# Altium schematic sheet Main.SchDoc: ControlBoard(Pump&Motor) V1.0
size A; DrawnBy: Jiang Lianhui; SheetNumber: 1; SheetTotal: 1
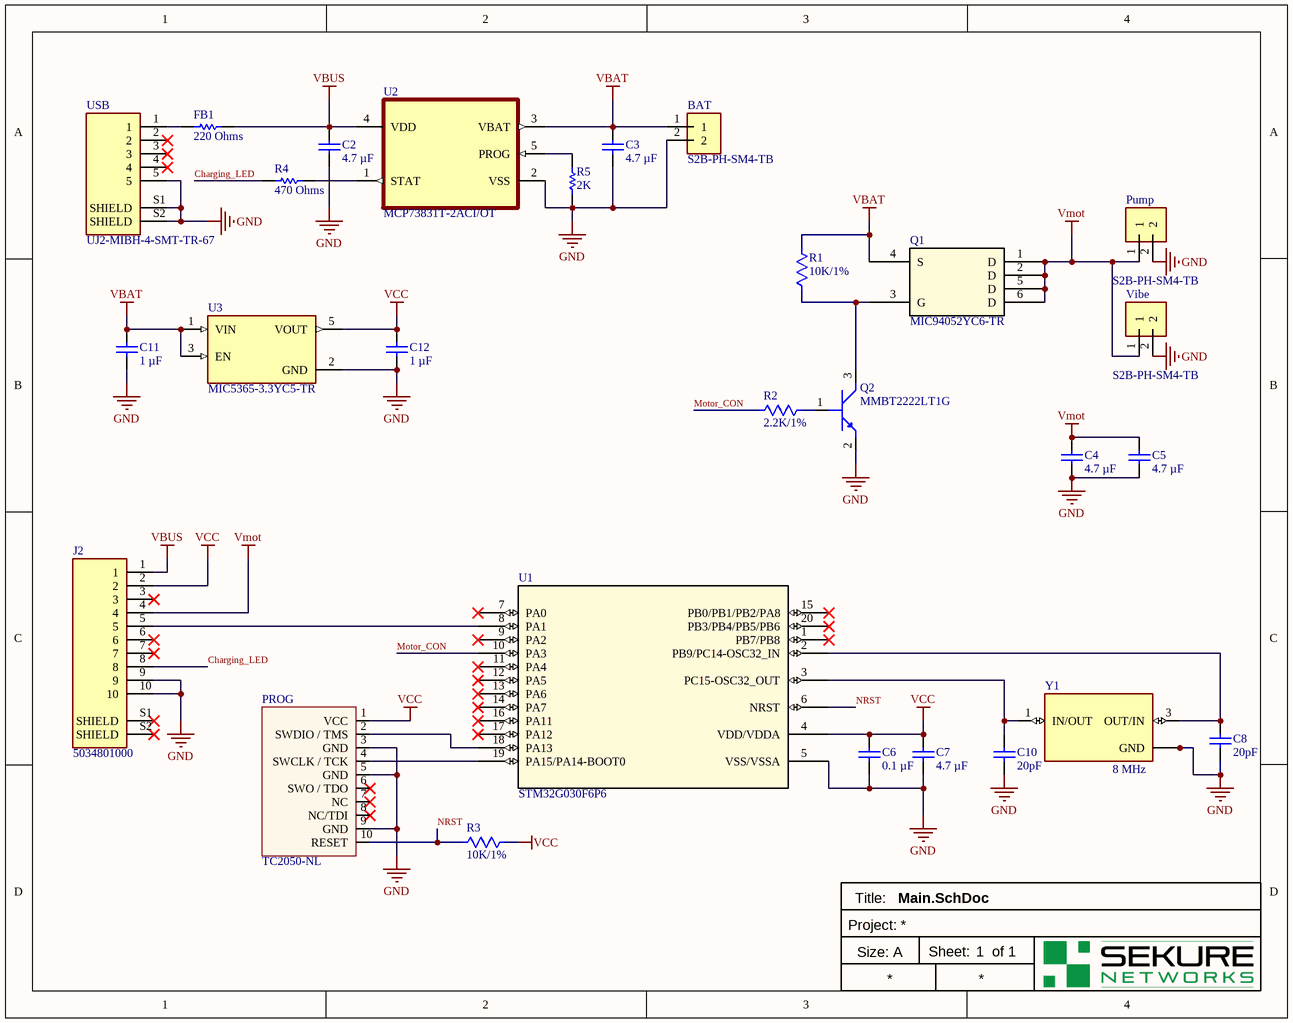
[diagram p0: Main.SchDoc]

## Parts
BAT  S2B-PH-SM4-TB  [JST_S2B-PH-SM4-TB]
C2  4.7 µF  [CAP0603]
C3  4.7 µF  [CAP0603]
C4  4.7 µF  [CAP0603]
C5  4.7 µF  [CAP0603]
C6  0.1 µF  [CAP0603]
C7  4.7 µF  [CAP0603]
C8  20pF  [CAP0603]
C10  20pF  [CAP0603]
C11  1 µF  [CAP0603]
C12  1 µF  [CAP0603]
FB1  220 Ohms  [RES_0603]
J2  5034801000  [MOLEX_5034801000]
PROG  value TC2050-NL  [TC2050]  (hidden comment: Programming Connector)
Pump  S2B-PH-SM4-TB  [JST_S2B-PH-SM4-TB]
Q1  MIC94052YC6-TR  [SC70-6_MC_MCH]
Q2  value MMBT2222LT1G  [SOT23]  (hidden comment: Transistor)
R1  value 10K/1%  [RES 0603]  (hidden comment: Resistor)
R2  value 2.2K/1%  [RES 0603]  (hidden comment: Resistor)
R3  value 10K/1%  [RES 0603]  (hidden comment: Resistor)
R4  470 Ohms  [RES_0603]
R5  2K  [RES_0603]
U1  STM32G030F6P6  [TSSOP20]
U2  MCP73831T-2ACI/OT  [SOT95P280X145-5N]
U3  MIC5365-3.3YC5-TR  [SOT65P210X110-5N]
USB  UJ2-MIBH-4-SMT-TR-67  [CUI_UJ2-MIBH-4-SMT-TR-67]
Vibe  S2B-PH-SM4-TB  [JST_S2B-PH-SM4-TB]
Y1  value 8 MHz  [XTAL_ECS-240-8-33-AGN-TR]  (hidden comment: ECS-80-12-33-JGN-TR)

## Nets
GND: BAT.2 C2.1 C3.1 C4.1 C5.1 C6.1 C7.1 C8.1 C10.1 C11.1 C12.1 J2.9 J2.10 PROG.3(GND) PROG.5(GND) PROG.9(GND) Pump.2 Q2.2(e) R5.1 U1.5(VSS/VSSA) U2.2(VSS) U3.2(GND) USB.5 USB.S1(SHIELD) USB.S2(SHIELD) Vibe.2 Y1.2(GND) Y1.4(GND)
VBAT: BAT.1 C3.2 C11.2 Q1.4(S) R1.2 U2.3(VBAT) U3.1(VIN) U3.3(EN)
VBUS: C2.2 FB1.2 J2.1 U2.4(VDD)
VCC: C6.2 C7.2 C12.2 J2.2 PROG.1(VCC) R3.2 U1.4(VDD/VDDA) U3.5(VOUT)
Vmot: C4.2 C5.2 J2.4 Pump.1 Q1.1(D) Q1.2(D) Q1.5(D) Q1.6(D) Vibe.1
Charging_LED: J2.8 R4.1
Motor_CON: R2.1 U1.10(PA3)
NRST: PROG.10(RESET) R3.1 U1.6(NRST)
NetC8_2: C8.2 U1.2(PB9/PC14-OSC32_IN) Y1.3(OUT/IN)
NetC10_2: C10.2 U1.3(PC15-OSC32_OUT) Y1.1(IN/OUT)
NetFB1_1: FB1.1 USB.1
NetJ2_5: J2.5 U1.8(PA1)
NetPROG_2: PROG.2(SWDIO_/_TMS) U1.18(PA13)
NetPROG_4: PROG.4(SWCLK_/_TCK) U1.19(PA15/PA14-BOOT0)
NetQ1_3: Q1.3(G) Q2.3(c) R1.1
NetQ2_1: Q2.1(b) R2.2
NetR4_2: R4.2 U2.1(STAT)
NetR5_2: R5.2 U2.5(PROG)

Not connected (* = marked no-connect by the designer): J2 3* 6* 7* S1(SHIELD)* S2(SHIELD)*; PROG 6(SWO_/_TDO)* 7(NC)* 8(NC/TDI)*; U1 1(PB7/PB8)* 7(PA0)* 9(PA2)* 11(PA4)* 12(PA5)* 13(PA6)* 14(PA7)* 15(PB0/PB1/PB2/PA8)* 16(PA11)* 17(PA12)* 20(PB3/PB4/PB5/PB6)*; USB 2* 3* 4*

## Notes on the sheet
- Title:
- Project:
- Size: A
- Sheet:
- of

## Library data of the parts
BAT Pump Vibe = S2B-PH-SM4-TB: Connector Header Surface Mount, Right Angle 2 position 0.079 (2.00mm); Part: S2B-PH-SM4-TB; Value: S2B-PH-SM4-TB
C2-C5 C7 = Capacitor: CAP CER 4.7UF 10V X5R 0603; Part: CL10A475KP8NNNC; Value: 4.7 µF
C6 = Capacitor: CAP CER 0.1UF 50V X7R 0603; Part: CL10B104KB8NNNC; Value: 0.1 µF
C8 C10 = Capacitor: CAP CER 20PF 50V C0G/NPO 0603; Part: CC0603JRNPO9BN200; Value: 20pF
C11 C12 = Capacitor: CAP CER 1UF 16V X7R 0603; Part: C0603C105K4RAC7867; Value: 1 µF
FB1 = Res: FERRITE BEAD 220 OHM 0603 1LN; Part: BLM18PG221SN1D; Value: 220 Ohms
J2 = 5034801000: 10 Position FFC, FPC Connector Contacts, Top and Bottom 0.020 _0.50mm_ Surface Mount, Right Angle; Value: 10; Part: 5034801000
PROG = TC2050: “No Legs” 10-pin Plug-of-Nails™ Cable fitted with a 10-pin 0.1″ pitch ribbon connector.; Assembly: DNP
Q1 = MIC94052YC6-TR: MOSFET P-CH 6V 2A SC70-6; Part: MIC94052YC6-TR; Value: MOSFET P-CH 6V 2A SC70-6
Q2 = MMBT2222LT1G: Small Signal Bipolar Transistor, 0.6A I(C), 30V V(BR)CEO, 1-Element, NPN, Silicon, TO-236; Manufacturer: ON Semiconductor; Package Body Material: Plastic; Max Collector Current: 600mA; DC Current Gain-Min (hFE): 75; Number of Elements: 1; Power Dissipation-Max (Abs): 225mW; Time @ Peak Reflow Temperature-Max (s): 40s; Transistor Application: SWITCHING; Frequency: 250MHz; Turn-off Time-Max (toff): 285ns; Turn-on Time-Max (ton): 35ns; Qualification Status: Not Qualified; Supplier: Digikey; DigiKey: MMBT2222LT1GOSCT-ND; P/N: MMBT2222LT1G; RoHS: Yes; Category: BJTs; Stock: 84926; Pricing: 1=0.14, 10=0.085, 100=0.0523, 500=0.03782, 1000=0.03311 (USD); Pins: 3; Package Shape: Rectangular; Terminal Finish: Tin; Transistor Element Material: SILICON; Max Operating Temperature: 150°C; JESD-609 Code: e3; Polarity/Channel Type: NPN; Collector-emitter Voltage-Max: 30V; JESD-30 Code: R-PDSO-G3; Moisture Sensitivity Level: 1; Package Style: SMALL OUTLINEMeter; Peak Reflow Temperature (Cel): 260°C; Surface Mount: Yes; Terminal Form: Gull Wing; Terminal Position: DUAL; JEDEC-95 Code: TO-236; Reach SVHC Compliant: Yes; RoHS Compliant: Yes; ComponentLink1URL: https://datasheet.ciiva.com:443/pdfs/VipMasterIC/IC/ONSM/ONSM-S-A0002809824/ONSM-S-A0002809824-1.pdf?src-supplier=IHS+Markit; ComponentLink1Description: https://datasheet.ciiva.com:443/pdfs/VipMasterIC/IC/ONSM/ONSM-S-A0002809824/ONSM-S-A0002809824-1.pdf?src-supplier=IHS+Markit; ComponentLink2URL: https://datasheet.ciiva.com/976/mmbt2222lt1-d-976368.pdf?src-supplier=Digikey; ComponentLink2Description: https://datasheet.ciiva.com/976/mmbt2222lt1-d-976368.pdf?src-supplier=Digikey; ComponentLink3URL: https://datasheet.ciiva.com/976/mmbt2222lt1-d-976369.pdf?src-supplier=Digikey; ComponentLink3Description: https://datasheet.ciiva.com/976/mmbt2222lt1-d-976369.pdf?src-supplier=Digikey; ComponentLink4URL: https://datasheet.ciiva.com/976/mmbt2222lt1-d-976370.pdf?src-supplier=Digikey; ComponentLink4Description: https://datasheet.ciiva.com/976/mmbt2222lt1-d-976370.pdf?src-supplier=Digikey; ComponentLink5URL: https://datasheet.ciiva.com/4721/mmbt2222lt1-d-80103-4721468.pdf?src-supplier=Mouser; ComponentLink5Description: https://datasheet.ciiva.com/4721/mmbt2222lt1-d-80103-4721468.pdf?src-supplier=Mouser; ComponentLink6URL: https://datasheet.ciiva.com/11198/mmbt2222lt1-d-11198974.pdf?src-supplier=Avnet; ComponentLink6Description: https://datasheet.ciiva.com/11198/mmbt2222lt1-d-11198974.pdf?src-supplier=Avnet; ComponentLink7URL: https://datasheet.ciiva.com/11201/mmbt2222lt1-d-11201758.pdf?src-supplier=Avnet; ComponentLink7Description: https://datasheet.ciiva.com/11201/mmbt2222lt1-d-11201758.pdf?src-supplier=Avnet; ComponentLink8URL: https://datasheet.ciiva.com/15224/getdatasheetpartid-91924-15224358.pdf?src-supplier=Verical; ComponentLink8Description: https://datasheet.ciiva.com/15224/getdatasheetpartid-91924-15224358.pdf?src-supplier=Verical
R1 R3 = RC0603FR-0710KL: RES SMD 10K OHM 1% 1/10W 0603; Manufacturer: Yageo; Resistance: 10kR; Power Rating: 100mW; Temperature Coefficient: 100ppm/°C; Voltage Rating: 75V; Voltage Rating (DC): 50V; Supplier 1: Digi-Key; P/N: RC0603FR-0710KL; Stock 1: 55833360; Pricing 1: 1=0.10000, 10=0.02300, 100=0.00940, 1000=0.00421, 2500=0.00366 (USD); RoHS: Yes; Case/Package: 0603; Number of Pins: 2; Weight: 7.1E-05oz; Case Code (Imperial): 0603; Case Code (Metric): 1608; Min Operating Temperature: -55°C; Max Operating Temperature: 155°C; Packaging: Tape and Reel; Tolerance: 1%; Composition: Thick Film; Termination: SMD/SMT; Military Standard: Not; Length: 1.6mm; Height: 0.45mm; Depth: 0.8mm; Width: 0.8mm; Lead Pitch: 0.3mm; Lead Free: Lead Free; REACH SVHC: No SVHC; ComponentLink1URL: https://datasheet.ciiva.com/7660/38590-7660789.pdf?src-supplier=Element14; ComponentLink1Description: https://datasheet.ciiva.com/7660/38590-7660789.pdf?src-supplier=Element14; ComponentLink2URL: https://datasheet.ciiva.com/15189/getdatasheetpartid-409289-15189591.pdf?src-supplier=Verical; ComponentLink2Description: https://datasheet.ciiva.com/15189/getdatasheetpartid-409289-15189591.pdf?src-supplier=Verical; ComponentLink3URL: https://datasheet.ciiva.com/46440/1868787-46440891.pdf?src-supplier=Element14; ComponentLink3Description: https://datasheet.ciiva.com/46440/1868787-46440891.pdf?src-supplier=Element14; ComponentLink4URL: https://datasheet.ciiva.com/7983/443971-7983596.pdf?src-supplier=Element14; ComponentLink4Description: https://datasheet.ciiva.com/7983/443971-7983596.pdf?src-supplier=Element14; ComponentLink5URL: https://datasheet.ciiva.com/7746/1738695-7746239.pdf?src-supplier=Element14; ComponentLink5Description: https://datasheet.ciiva.com/7746/1738695-7746239.pdf?src-supplier=Element14; ComponentLink6URL: https://datasheet.ciiva.com/22747/443971-22747519.pdf?src-supplier=Element14; ComponentLink6Description: https://datasheet.ciiva.com/22747/443971-22747519.pdf?src-supplier=Element14; DigiKey: 311-10.0KHRDKR-ND
R2 = CRCW06032K20FKEA: RES SMD 2.2K OHM 1% 1/10W 0603; Manufacturer: Vishay; Resistance: 2.2kR; Temperature Coefficient: 100ppm/°C; Power Rating: 100mW; Voltage Rating: 75V; Supplier 1: Digi-Key; P/N: CRCW06032K20FKEA; Stock 1: 98601; Pricing 1: 1=0.10000, 10=0.03400, 100=0.01390, 1000=0.00623, 2500=0.00540 (USD); RoHS: Yes; Mount: Surface Mount; Case/Package: 0603; Weight: 7.1E-05oz; Case Code (Metric): 1608; Case Code (Imperial): 0603; Contact Plating: Tin; Min Operating Temperature: -55°C; Max Operating Temperature: 155°C; Tolerance: 1%; Packaging: Tape and Reel; Composition: Thick Film; Termination: SMD/SMT; Package Quantity: 10; Voltage Rating (DC): 75V; Number of Terminations: 2; Max Power Dissipation: 100mW; Military Standard: Not; Features: Automotive AEC-Q200; Length: 1.55mm; Height: 0.45mm; Width: 0.033inch; Depth: 0.85mm; Radiation Hardening: No; Lead Free: Lead Free; REACH SVHC: Unknown; ComponentLink1URL: https://datasheet.ciiva.com/11809/0900766b80d98afc-11809110.pdf?src-supplier=RSComponents; ComponentLink1Description: https://datasheet.ciiva.com/11809/0900766b80d98afc-11809110.pdf?src-supplier=RSComponents; ComponentLink2URL: https://datasheet.ciiva.com/26314/fld-crcw-e3-data-en-26314687.pdf?src-supplier=Distrelec; ComponentLink2Description: https://datasheet.ciiva.com/26314/fld-crcw-e3-data-en-26314687.pdf?src-supplier=Distrelec; ComponentLink3URL: https://datasheet.ciiva.com/2465/dcrcwe3-2465603.pdf?src-supplier=Digi-Key; ComponentLink3Description: https://datasheet.ciiva.com/2465/dcrcwe3-2465603.pdf?src-supplier=Digi-Key; ComponentLink4URL: https://datasheet.ciiva.com/2465/dcrcwe3-2465604.pdf?src-supplier=Digi-Key; ComponentLink4Description: https://datasheet.ciiva.com/2465/dcrcwe3-2465604.pdf?src-supplier=Digi-Key; ComponentLink5URL: https://datasheet.ciiva.com/2465/dcrcwe3-2465605.pdf?src-supplier=Digi-Key; ComponentLink5Description: https://datasheet.ciiva.com/2465/dcrcwe3-2465605.pdf?src-supplier=Digi-Key; ComponentLink6URL: https://datasheet.ciiva.com/7777/1697337-7777306.pdf?src-supplier=Element14; ComponentLink6Description: https://datasheet.ciiva.com/7777/1697337-7777306.pdf?src-supplier=Element14; ComponentLink7URL: https://datasheet.ciiva.com/3257/dcrcwe3-3257374.pdf?src-supplier=Avnet; ComponentLink7Description: https://datasheet.ciiva.com/3257/dcrcwe3-3257374.pdf?src-supplier=Avnet; ComponentLink8URL: https://datasheet.ciiva.com/5543/dcrcwe3-109170-5543147.pdf?src-supplier=Mouser; ComponentLink8Description: https://datasheet.ciiva.com/5543/dcrcwe3-109170-5543147.pdf?src-supplier=Mouser; ComponentLink9URL: https://datasheet.ciiva.com/3257/dcrcwe3-3257375.pdf?src-supplier=Avnet; ComponentLink9Description: https://datasheet.ciiva.com/3257/dcrcwe3-3257375.pdf?src-supplier=Avnet; ComponentLink10URL: https://datasheet.ciiva.com/16218/dcrcwe3-16218063.pdf?src-supplier=Future+Electronics; ComponentLink10Description: https://datasheet.ciiva.com/16218/dcrcwe3-16218063.pdf?src-supplier=Future+Electronics; DigiKey: 541-2.20KHCT-ND
R4 = Res: RES SMD 470 OHM 1% 1/10W 0603; Part: CR0603-FX-4700ELF; Value: 470 Ohms
R5 = Res: RES SMD 2K OHM 1% 1/10W 0603; Part: CR0603-FX-2001ELF; Value: 2K
U1 = STM32G030F6P6: No Description Available; Part: STM32G030F6P6; Value: STM32G030F6P6
U2 = MCP73831T-2ACI/OT: Charger IC Lithium Ion/Polymer SOT-23-5; Part: MCP73831T-2ACI/OT; Value: MCP73831T-2ACI/OT
U3 = MIC5365-3.3YC5-TR: Linear Voltage Regulator IC 1 Output 150mA SC-70-5; Value: 3V3 LDO; MP: MIC5365-3.3YC5-TR
USB = UJ2-MIBH-4-SMT-TR-67: Micro B, USB 2.0, 1.8 A, Right Angle, Surface Mount (SMT), Waterproof, USB Receptacle; Value: USB 2.0; Part: UJ2-MIBH-4-SMT-TR-67
Y1 = ECS-80-12-33-JGN-TR: 8MHz Â±20ppm Crystal 12pF 400 Ohms 4-SMD, No Lead; MF: ECS-80-12-33-JGN-TR